# Altium project ABA.PrjPcb
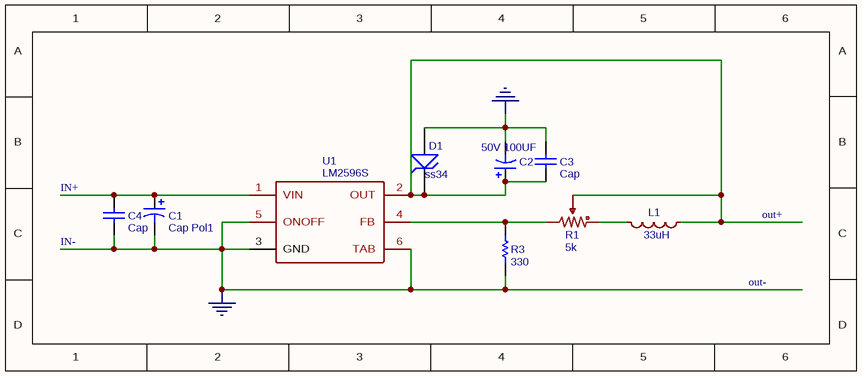
[diagram p0: lm2596s schematic_2022-12-24.schdoc]
1 sheet, 9 parts. Net scope: global (net labels, ports and power ports of the same name join across sheets).
Board file: LM2596S pcb_2022-12-24.pcbdoc

## Sheet lm2596s schematic_2022-12-24.schdoc
size 160 x 68 mm; SheetNumber: 1; SheetTotal: 1

### Parts
C1  Cap Pol1  [CAP8*12]
C2  50V 100UF  [CAP8*12]
C3  Cap  [C0805]
C4  Cap  [C0805]
D1  ss34  [DIODES_PICK]
L1  33uH  [CD127 12*12*7MM]
R1  5k  [RW]
R3  330  [C0805]
U1  LM2596S  [TS5B]

### Nets
IN-: C1.2 C2.2 C3.2 C4.1 D1.1(A) R3.1 U1.3(GND) U1.5(ONOFF) U1.6(TAB)  [also labelled GND, out-]
IN+: C1.1 C4.2 U1.1(VIN)
out+: C2.1 C3.1 D1.2(K) L1.P$1 R1.2 U1.2(OUT)
NetL1_P$2: L1.P$2 R1.3
NetR1_1: R1.1 R3.2 U1.4(FB)

### Library data of the parts
C1 = Cap Pol1: catid: 20; sourceId: d1VdvpHhC; timeStamp: 1452930407; BOM_Manufacturer Part: ?; spicePre: C
C2 = 50V 100UF: catid: 20; sourceId: d1VdvpHhC; timeStamp: 1452930407; BOM_Manufacturer Part: ?; spicePre: C
C3 C4 = Cap: catid: 20; sourceId: aYgasJ1jB; timeStamp: 1452930407; BOM_Manufacturer Part: ?; spicePre: C
D1 = ss34: catid: 20; sourceId: RpmkigCAV; timeStamp: 1453706919; BOM_Manufacturer Part: ?; spicePre: D
L1 = 33uH: nameAlias: Value(H); BOM_Manufacturer Part: ?; spicePre: L; spiceSymbolName: Inductor
R1 = 5k: nameAlias: Value(Ω); Model: Potentiometer; K(%): 50; spicePre: X; BOM_Manufacturer Part: ?; spiceSymbolName: Potentiometer
R3 = 330: catid: 20; sourceId: RoYWUgdzx; timeStamp: 1453706919; BOM_Manufacturer Part: ?; spicePre: R
U1 = LM2596S: catid: 20; sourceId: NUuTiVRn0; timeStamp: 1457681323; BOM_Manufacturer Part: ?; spicePre: U